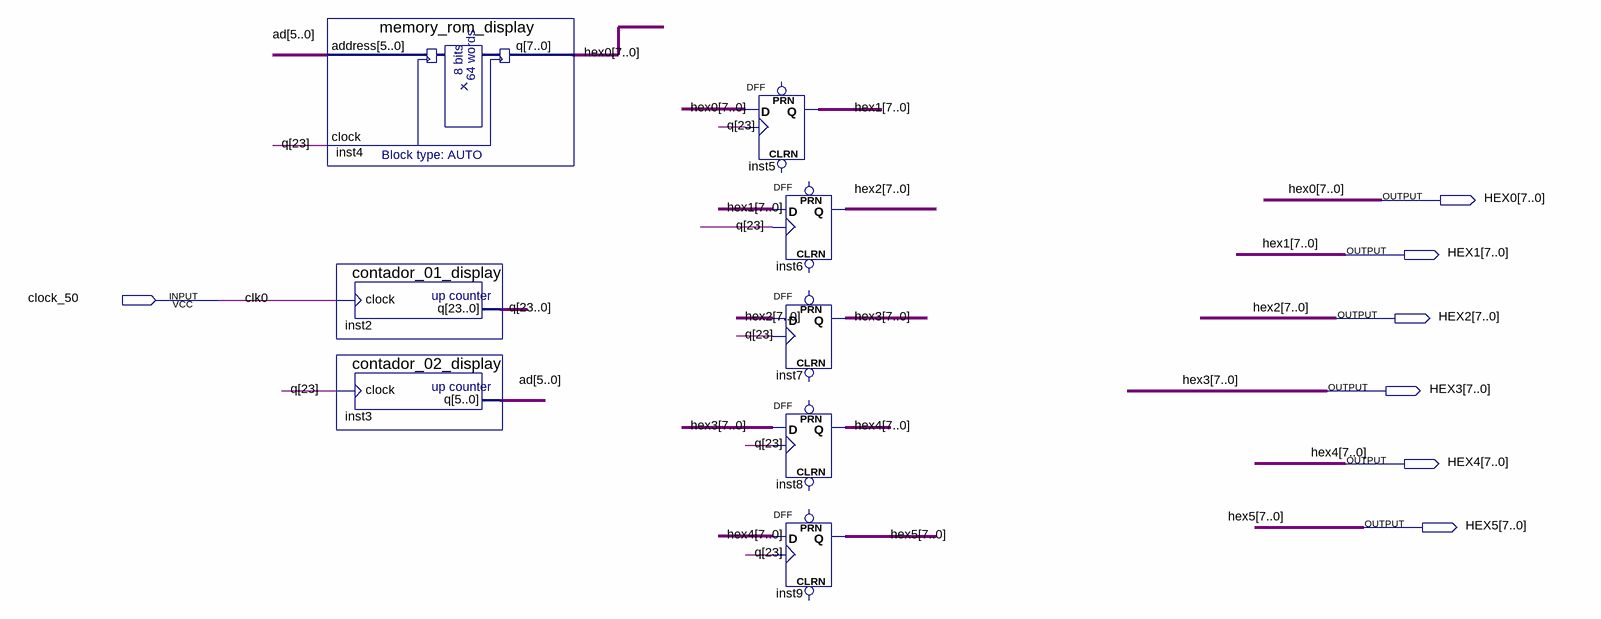
[diagram p0: schematic sheet]
// Quartus schematic texto_display.bdf as structural Verilog: 8 symbols, 7 pins
module texto_display (
  input  clock_50,
  output [7:0] HEX0,
  output [7:0] HEX1,
  output [7:0] HEX2,
  output [7:0] HEX3,
  output [7:0] HEX4,
  output [7:0] HEX5
);

  wire [5:0] ad;
  wire [23:0] q;

  memory_rom_display inst4 (.address(ad), .clock(q[23]), .q(HEX0));
  contador_01_display inst2 (.clock(clock_50), .q(q));
  contador_02_display inst3 (.clock(q[23]), .q(ad));
  DFF inst5[7:0] (.CLK(q[23]), .D(HEX0), .Q(HEX1));  // open: CLRN, PRN
  DFF inst6[7:0] (.CLK(q[23]), .D(HEX1), .Q(HEX2));  // open: CLRN, PRN
  DFF inst7[7:0] (.CLK(q[23]), .D(HEX2), .Q(HEX3));  // open: CLRN, PRN
  DFF inst8[7:0] (.CLK(q[23]), .D(HEX3), .Q(HEX4));  // open: CLRN, PRN
  DFF inst9[7:0] (.CLK(q[23]), .D(HEX4), .Q(HEX5));  // open: CLRN, PRN

  // Other names for the same wires on the sheet: clk0 = clock_50
endmodule
